# Altium schematic sheet S7_Uart.SchDoc
size 420 x 297 mm; SheetNumber: 7; SheetTotal: 11
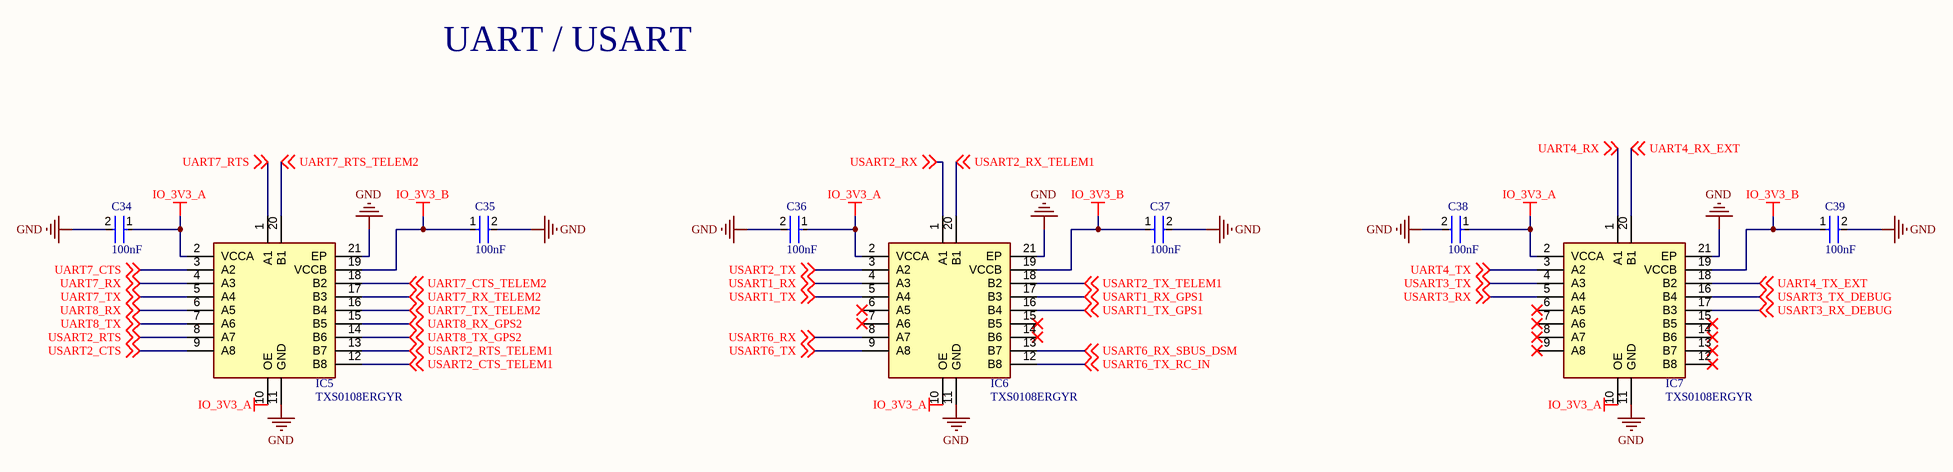
[diagram p0: S7_Uart.SchDoc]

## Parts
C34  100nF  [FP-CC0402-MFG]
C35  100nF  [FP-CC0402-MFG]
C36  100nF  [FP-CC0402-MFG]
C37  100nF  [FP-CC0402-MFG]
C38  100nF  [FP-CC0402-MFG]
C39  100nF  [FP-CC0402-MFG]
IC5  TXS0108ERGYR  [SN74LVC541ARGYR]
IC6  TXS0108ERGYR  [SN74LVC541ARGYR]
IC7  TXS0108ERGYR  [SN74LVC541ARGYR]

## Nets
GND: C34.2 C35.2 C36.2 C37.2 C38.2 C39.2 IC5.11(GND) IC5.21(EP) IC6.11(GND) IC6.21(EP) IC7.11(GND) IC7.21(EP)
IO_3V3_A: C34.1 C36.1 C38.1 IC5.2(VCCA) IC5.10(OE) IC6.2(VCCA) IC6.10(OE) IC7.2(VCCA) IC7.10(OE)
IO_3V3_B: C35.1 C37.1 C39.1 IC5.19(VCCB) IC6.19(VCCB) IC7.19(VCCB)
UART4_RX: IC7.1(A1) ; off-sheet UART4_RX
UART4_RX_EXT: IC7.20(B1) ; off-sheet UART4_RX_EXT
UART4_TX: IC7.3(A2) ; off-sheet UART4_TX
UART4_TX_EXT: IC7.18(B2) ; off-sheet UART4_TX_EXT
UART7_CTS: IC5.3(A2) ; off-sheet UART7_CTS
UART7_CTS_TELEM2: IC5.18(B2) ; off-sheet UART7_CTS_TELEM2
UART7_RTS: IC5.1(A1) ; off-sheet UART7_RTS
UART7_RTS_TELEM2: IC5.20(B1) ; off-sheet UART7_RTS_TELEM2
UART7_RX: IC5.4(A3) ; off-sheet UART7_RX
UART7_RX_TELEM2: IC5.17(B3) ; off-sheet UART7_RX_TELEM2
UART7_TX: IC5.5(A4) ; off-sheet UART7_TX
UART7_TX_TELEM2: IC5.16(B4) ; off-sheet UART7_TX_TELEM2
UART8_RX: IC5.6(A5) ; off-sheet UART8_RX
UART8_RX_GPS2: IC5.15(B5) ; off-sheet UART8_RX_GPS2
UART8_TX: IC5.7(A6) ; off-sheet UART8_TX
UART8_TX_GPS2: IC5.14(B6) ; off-sheet UART8_TX_GPS2
USART1_RX: IC6.4(A3) ; off-sheet USART1_RX
USART1_RX_GPS1: IC6.17(B3) ; off-sheet USART1_RX_GPS1
USART1_TX: IC6.5(A4) ; off-sheet USART1_TX
USART1_TX_GPS1: IC6.16(B4) ; off-sheet USART1_TX_GPS1
USART2_CTS: IC5.9(A8) ; off-sheet USART2_CTS
USART2_CTS_TELEM1: IC5.12(B8) ; off-sheet USART2_CTS_TELEM1
USART2_RTS: IC5.8(A7) ; off-sheet USART2_RTS
USART2_RTS_TELEM1: IC5.13(B7) ; off-sheet USART2_RTS_TELEM1
USART2_RX: IC6.1(A1) ; off-sheet USART2_RX
USART2_RX_TELEM1: IC6.20(B1) ; off-sheet USART2_RX_TELEM1
USART2_TX: IC6.3(A2) ; off-sheet USART2_TX
USART2_TX_TELEM1: IC6.18(B2) ; off-sheet USART2_TX_TELEM1
USART3_RX: IC7.5(A4) ; off-sheet USART3_RX
USART3_RX_DEBUG: IC7.17(B3) ; off-sheet USART3_RX_DEBUG
USART3_TX: IC7.4(A3) ; off-sheet USART3_TX
USART3_TX_DEBUG: IC7.16(B4) ; off-sheet USART3_TX_DEBUG
USART6_RX: IC6.8(A7) ; off-sheet USART6_RX
USART6_RX_SBUS_DSM: IC6.13(B7) ; off-sheet USART6_RX_SBUS_DSM
USART6_TX: IC6.9(A8) ; off-sheet USART6_TX
USART6_TX_RC_IN: IC6.12(B8) ; off-sheet USART6_TX_RC_IN

Not connected (* = marked no-connect by the designer): IC6 6(A5)* 7(A6)* 14(B6)* 15(B5)*; IC7 6(A5)* 7(A6)* 8(A7)* 9(A8)* 12(B8)* 13(B7)* 14(B6)* 15(B5)*

## Notes on the sheet
- UART / USART
- THIS DOCUMENT AND THE DATA DISCLOSED HEREIN OR
- HEREWITH IS THE PROPERTY OF ALTIUM LIMITED AND MAY
- DWG NO:
- REVISION
- REV:
- DESCRIPTION
- DATE
- APPROVED
- BE FREELY DISTRIBUTED IN WHOLE. NO RIGHTS ARE
- RESERVED OR EXPRESS OR IMPLIED WARANTEE GIVEN.
- ENG:
- APPROVALS
- PROJECT
- DSN:
- CHK:
- REFERENCE DOCUMENTS
- PROJECT REVISION:
- TITLE
- DOCUMENT REVISION:
- DESIGN ITEM:
- BOM:
- FAB DWG:
- PCB DWG:
- ASSY DWG:
- SCALE:
- A3
- SIZE
- CAGE CODE
- FILE NAME
- DWG NO.
- SHEET
- OF
- REV

## Library data of the parts
C34-C39 = CMP-03422-001121-1: CAP CER 0.1UF 16V X7R 0402; Manufacturer: YAGEO; Manufacturer Part Number: CC0402KPX7R7BB104; Material: Ceramic; Temperature Coefficient: 30ppm/°C; Automotive Grade: NA; Tolerance: 0.1; Digikey Description: CAP CER 0.1UF 16V X7R 0402; Temperature Range Low: -55°C; Footprint Url: http://www.yageo.com/exep/pages/download/literatures/UPY-C_GEN_24.pdf; RoHS: TRUE; Device Class L3: Ceramic Capacitors; Temperature Characteristic: X7R; Capacitance: 100 nF; Package: CC0402; Device Class L1: Passive Components; Lead Free: Yes; Temperature Range High: +125°C; Category: Cap; Mouser Description: 0402 0.1 uF 16 V ±10% Tolerance X7R SMT Multilayer Ceramic Capacitor; Voltage Rating: 16 V; Value: 100 nF; ComponentLink2Description: Datasheet; Automotive: No; Octopart: https://octopart.com/cc0402kpx7r7bb104-yageo-21548559; ComponentLink2URL: http://www.yageo.com/documents/recent/UPY-GP_NP0_16V-to-50V_16.pdf; Height: 0.55mm; Device Class L2: Capacitors; Temperature: -55°C to +125°C; Ipc Land Pattern Name: CAPC10050X50
IC5-IC7 = TXS0108ERGYR: Integrated Circuit; Manufacturer_Name: Texas Instruments; Datasheet Link: http://www.ti.com/lit/gpn/txs0108e; Height: 1mm; Manufacturer_Part_Number: TXS0108ERGYR; Mouser Part Number: 595-TXS0108ERGYR; Mouser Price/Stock: https://www.mouser.co.uk/ProductDetail/Texas-Instruments/TXS0108ERGYR?qs=dqESbKqT1jau1kZv8JPj9Q%3D%3D; Arrow Part Number: TXS0108ERGYR; Arrow Price/Stock: https://www.arrow.com/en/products/txs0108ergyr/texas-instruments?utm_currency=USD&region=nac